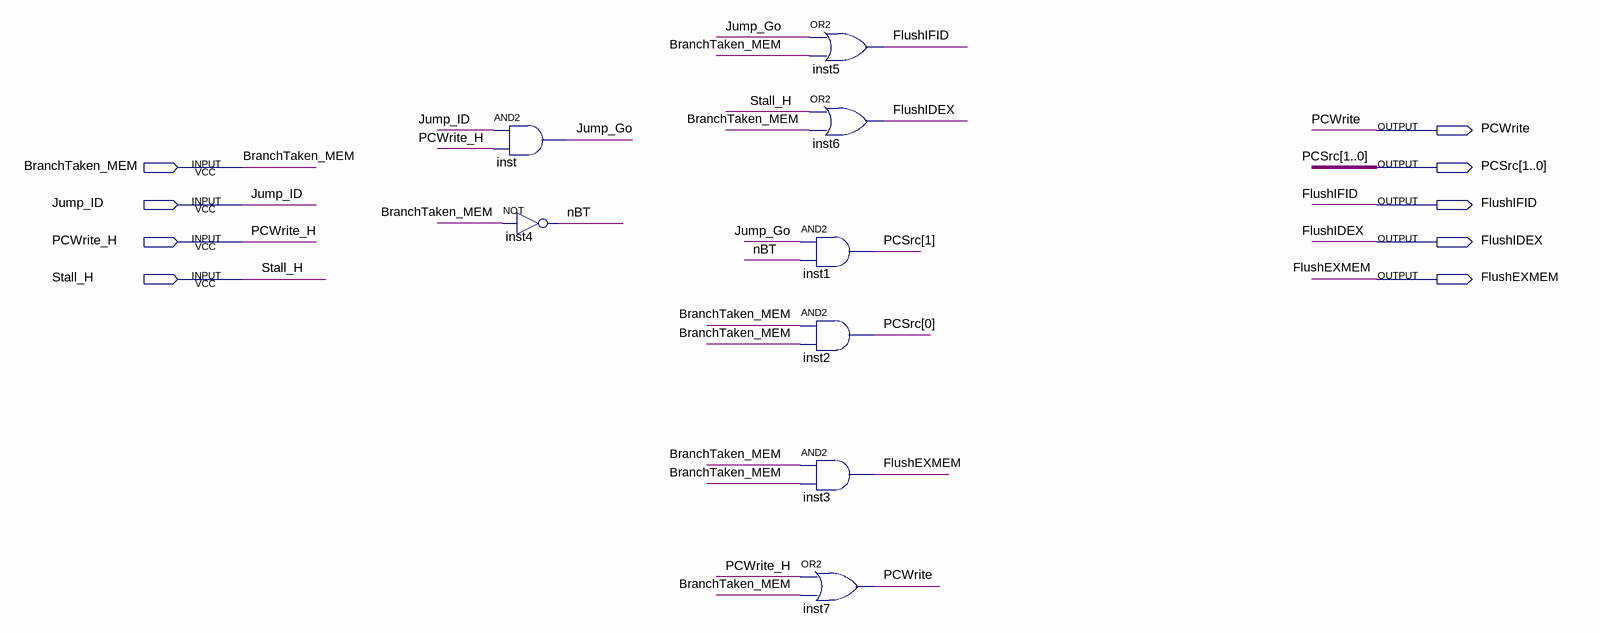
[diagram p0: schematic sheet]
// Quartus schematic FlushControl.bdf as structural Verilog: 8 symbols, 9 pins
module FlushControl (
  input  BranchTaken_MEM,
  input  Jump_ID,
  input  PCWrite_H,
  input  Stall_H,
  output PCWrite,
  output [1:0] PCSrc,
  output FlushIFID,
  output FlushIDEX,
  output FlushEXMEM
);

  wire Jump_Go, nBT;

  and inst (Jump_Go, Jump_ID, PCWrite_H);
  not inst4 (nBT, BranchTaken_MEM);
  and inst1 (PCSrc[1], Jump_Go, nBT);
  and inst2 (PCSrc[0], BranchTaken_MEM, BranchTaken_MEM);
  and inst3 (FlushEXMEM, BranchTaken_MEM, BranchTaken_MEM);
  or inst7 (PCWrite, PCWrite_H, BranchTaken_MEM);
  or inst5 (FlushIFID, Jump_Go, BranchTaken_MEM);
  or inst6 (FlushIDEX, Stall_H, BranchTaken_MEM);
endmodule
